# Altium schematic sheet Connector-Sheet.SchDoc
size A4; SheetNumber: 10; SheetTotal: 10
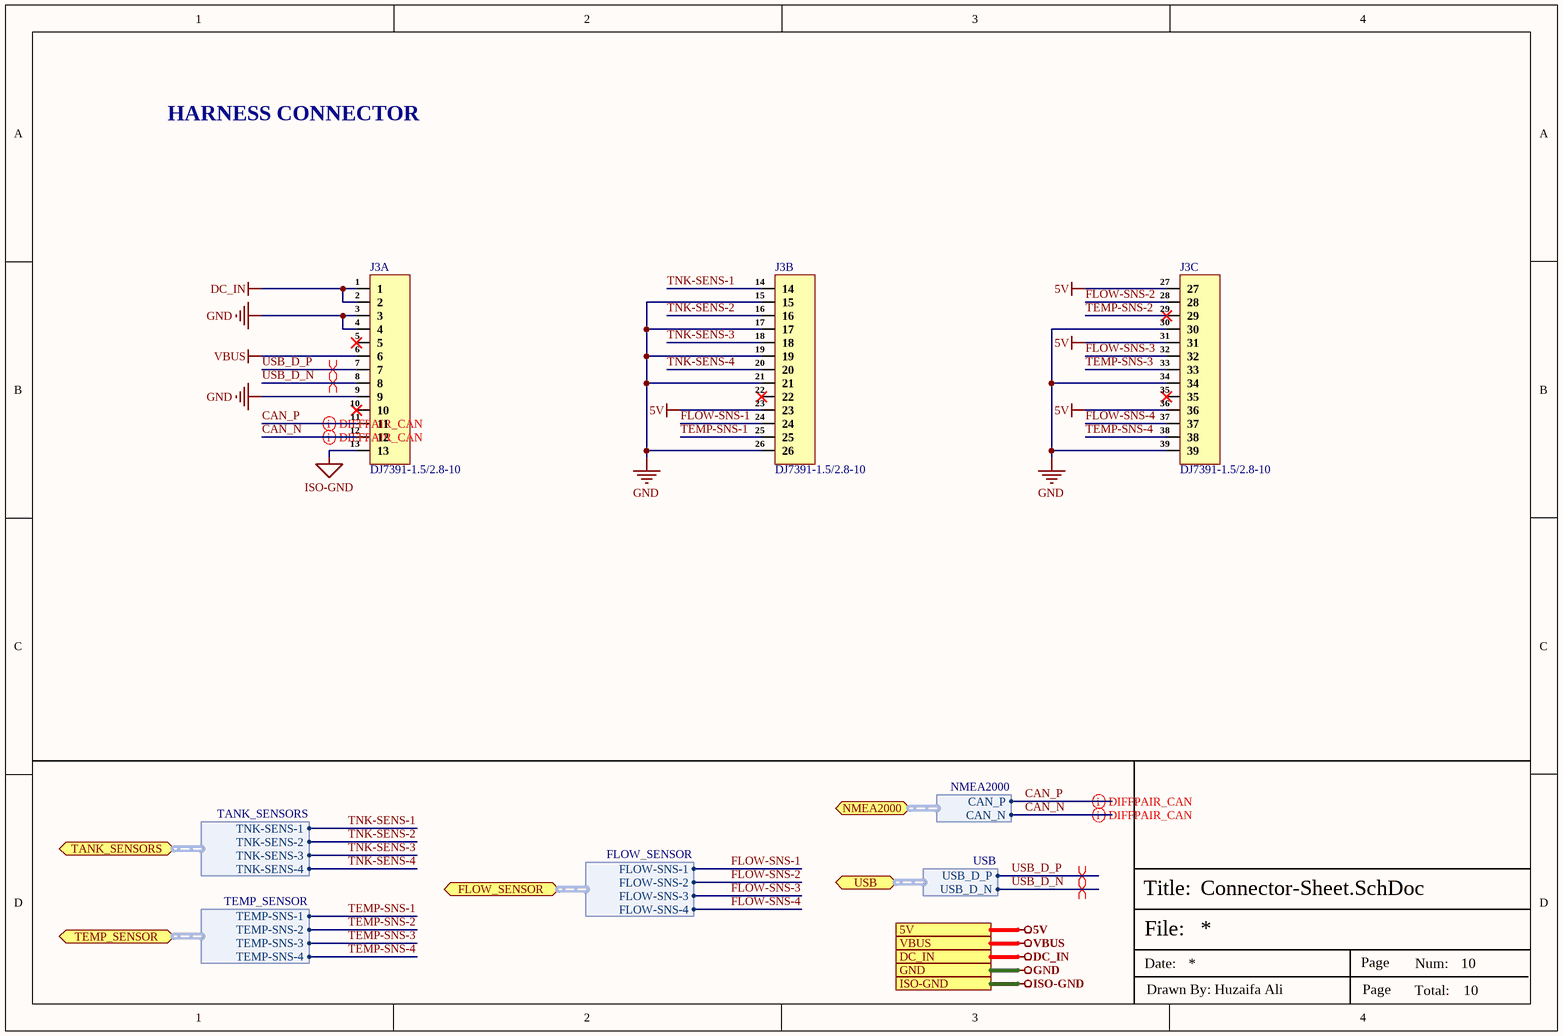
[diagram p0: Connector-Sheet.SchDoc]

## Parts
J3  DJ7391-1.5/2.8-10  [DJ7391-1.5/2.8-10]  (parts A,B,C of 3)

## Ports
5V (see Top-Sheet[1C], CAN-Transceiver-Sheet[3D], Fuel-Sensor-Sheet[4C], Power-Sheet-1[3D], Power-Sheet-2[3D]), DC_IN (see Top-Sheet[1C], Power-Sheet-1[3D]), FLOW_SENSOR (bidir, harness FLOW_SENSOR, see Top-Sheet[2C], Fuel-Sensor-Sheet[2D]), GND (see Top-Sheet[1C], CAN-Transceiver-Sheet[3D], Controller-Sheet[3D], Fuel-Sensor-Sheet[4C], Power-Sheet-1[3D], Power-Sheet-2[3D], Storage-Sheet[3D], Tank-Level-Sensor-Sheet[3D], USB-to-UART-Sheet[3D]), ISO-GND (see Top-Sheet[1C], CAN-Transceiver-Sheet[3D], Power-Sheet-2[3D]), NMEA2000 (bidir, harness NMEA2000, see Top-Sheet[2C], CAN-Transceiver-Sheet[2D]), TANK_SENSORS (bidir, harness TANK_SENSORS, see Top-Sheet[2C], Tank-Level-Sensor-Sheet[1D]), TEMP_SENSOR (bidir, harness TEMP_SENSOR, see Top-Sheet[2C], Fuel-Sensor-Sheet[2C]), USB (bidir, harness USB, see Top-Sheet[1C], USB-to-UART-Sheet[2D]), VBUS (see Top-Sheet[1C], USB-to-UART-Sheet[3D])

## Harnesses
USB: USB_D_P, USB_D_N
NMEA2000: CAN_P, CAN_N
TANK_SENSORS: TNK-SENS-1, TNK-SENS-2, TNK-SENS-3, TNK-SENS-4
TEMP_SENSOR: TEMP-SNS-1, TEMP-SNS-2, TEMP-SNS-3, TEMP-SNS-4
FLOW_SENSOR: FLOW-SNS-1, FLOW-SNS-2, FLOW-SNS-3, FLOW-SNS-4

## Nets
5V: J3.23 J3.27 J3.31 J3.36 ; port 5V
DC_IN: J3.1 J3.2 ; port DC_IN
GND: J3.3 J3.4 J3.9 J3.15 J3.17 J3.19 J3.21 J3.26 J3.30 J3.34 J3.39 ; port GND
ISO-GND: J3.13 ; port ISO-GND
VBUS: J3.6 ; port VBUS
CAN_N: J3.12 ; port NMEA2000.CAN_N
CAN_P: J3.11 ; port NMEA2000.CAN_P
FLOW-SNS-1: J3.24 ; port FLOW_SENSOR.FLOW-SNS-1
FLOW-SNS-2: J3.28 ; port FLOW_SENSOR.FLOW-SNS-2
FLOW-SNS-3: J3.32 ; port FLOW_SENSOR.FLOW-SNS-3
FLOW-SNS-4: J3.37 ; port FLOW_SENSOR.FLOW-SNS-4
TEMP-SNS-1: J3.25 ; port TEMP_SENSOR.TEMP-SNS-1
TEMP-SNS-2: J3.29 ; port TEMP_SENSOR.TEMP-SNS-2
TEMP-SNS-3: J3.33 ; port TEMP_SENSOR.TEMP-SNS-3
TEMP-SNS-4: J3.38 ; port TEMP_SENSOR.TEMP-SNS-4
TNK-SENS-1: J3.14 ; port TANK_SENSORS.TNK-SENS-1
TNK-SENS-2: J3.16 ; port TANK_SENSORS.TNK-SENS-2
TNK-SENS-3: J3.18 ; port TANK_SENSORS.TNK-SENS-3
TNK-SENS-4: J3.20 ; port TANK_SENSORS.TNK-SENS-4
USB_D_N: J3.8 ; port USB.USB_D_N
USB_D_P: J3.7 ; port USB.USB_D_P

Not connected (* = marked no-connect by the designer): J3 5* 10* 22* 35*

## Layout directives
differential pair; net class USB; differential pair class USB_Lines; rule Impedance Constraint [Min = 85.00    Max = 90.00    ]; rule Matched Net Lengths [Tolerance = 50mil]: USB_D_N, USB_D_P
differential pair; net class CAN; differential pair class CAN_Lines: CAN_N, CAN_P

## Notes on the sheet
- HARNESS CONNECTOR
- File:
- Title:
- Date:
- Page
- Num:
- Total:
- Drawn By: Huzaifa Ali